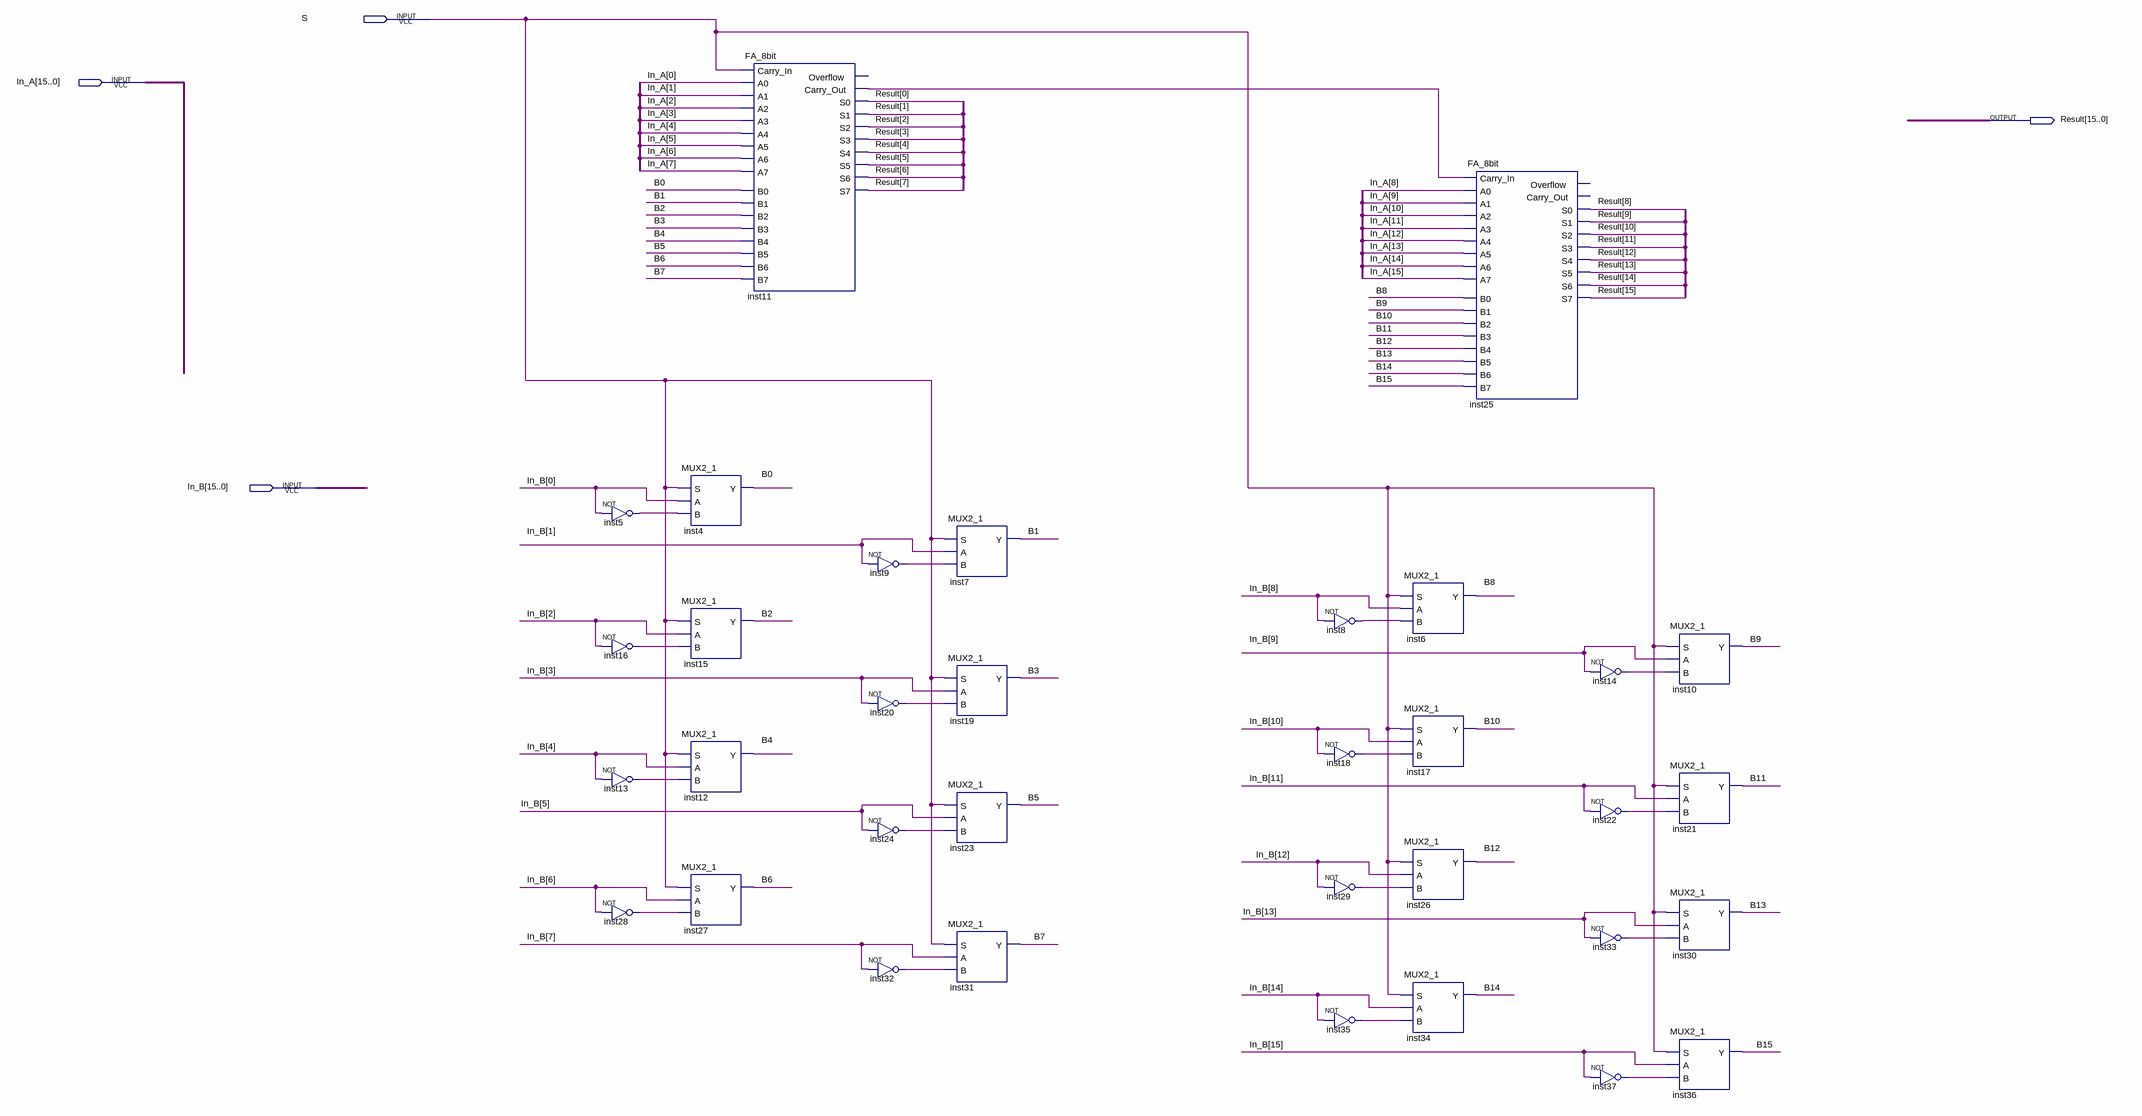
[diagram p0: schematic sheet]
// Quartus schematic Add_Sub_16bit.bdf as structural Verilog: 34 symbols, 4 pins
module Add_Sub_16bit (
  input  S,
  input  [15:0] In_A,
  input  [15:0] In_B,
  output [15:0] Result
);

  wire B0, B1, B2, B3, B4, B5, B6, B7, B8, B9, B10, B11, B12, B13, B14, B15, inst5_out, inst8_out, inst9_out,
       inst11_carry_out, inst13_out, inst14_out, inst16_out, inst18_out, inst20_out, inst22_out, inst24_out,
       inst28_out, inst29_out, inst32_out, inst33_out, inst35_out, inst37_out;

  not inst5 (inst5_out, In_B[0]);
  not inst16 (inst16_out, In_B[2]);
  not inst13 (inst13_out, In_B[4]);
  not inst28 (inst28_out, In_B[6]);
  MUX2_1 inst4 (.S(S), .A(In_B[0]), .B(inst5_out), .Y(B0));
  MUX2_1 inst15 (.S(S), .A(In_B[2]), .B(inst16_out), .Y(B2));
  MUX2_1 inst12 (.S(S), .A(In_B[4]), .B(inst13_out), .Y(B4));
  MUX2_1 inst27 (.S(S), .A(In_B[6]), .B(inst28_out), .Y(B6));
  FA_8bit inst11 (
    .A0(In_A[0]), .B0(B0), .B1(B1), .A1(In_A[1]), .B2(B2), .A2(In_A[2]), .B3(B3), .A3(In_A[3]), .A4(In_A[4]),
    .B4(B4), .B5(B5), .A5(In_A[5]), .B6(B6), .A6(In_A[6]), .B7(B7), .A7(In_A[7]), .Carry_In(S),
    .Carry_Out(inst11_carry_out), .S0(Result[0]), .S1(Result[1]), .S2(Result[2]), .S3(Result[3]),
    .S4(Result[4]), .S5(Result[5]), .S6(Result[6]), .S7(Result[7]));  // open: Overflow
  not inst9 (inst9_out, In_B[1]);
  not inst20 (inst20_out, In_B[3]);
  not inst24 (inst24_out, In_B[5]);
  not inst32 (inst32_out, In_B[7]);
  MUX2_1 inst7 (.S(S), .A(In_B[1]), .B(inst9_out), .Y(B1));
  MUX2_1 inst19 (.S(S), .A(In_B[3]), .B(inst20_out), .Y(B3));
  MUX2_1 inst23 (.S(S), .A(In_B[5]), .B(inst24_out), .Y(B5));
  MUX2_1 inst31 (.S(S), .A(In_B[7]), .B(inst32_out), .Y(B7));
  not inst8 (inst8_out, In_B[8]);
  not inst18 (inst18_out, In_B[10]);
  not inst29 (inst29_out, In_B[12]);
  not inst35 (inst35_out, In_B[14]);
  MUX2_1 inst6 (.S(S), .A(In_B[8]), .B(inst8_out), .Y(B8));
  MUX2_1 inst17 (.S(S), .A(In_B[10]), .B(inst18_out), .Y(B10));
  MUX2_1 inst26 (.S(S), .A(In_B[12]), .B(inst29_out), .Y(B12));
  MUX2_1 inst34 (.S(S), .A(In_B[14]), .B(inst35_out), .Y(B14));
  FA_8bit inst25 (
    .A0(In_A[8]), .B0(B8), .B1(B9), .A1(In_A[9]), .B2(B10), .A2(In_A[10]), .B3(B11), .A3(In_A[11]),
    .A4(In_A[12]), .B4(B12), .B5(B13), .A5(In_A[13]), .B6(B14), .A6(In_A[14]), .B7(B15), .A7(In_A[15]),
    .Carry_In(inst11_carry_out), .S0(Result[8]), .S1(Result[9]), .S2(Result[10]), .S3(Result[11]),
    .S4(Result[12]), .S5(Result[13]), .S6(Result[14]), .S7(Result[15]));  // open: Overflow, Carry_Out
  not inst14 (inst14_out, In_B[9]);
  not inst22 (inst22_out, In_B[11]);
  not inst33 (inst33_out, In_B[13]);
  not inst37 (inst37_out, In_B[15]);
  MUX2_1 inst10 (.S(S), .A(In_B[9]), .B(inst14_out), .Y(B9));
  MUX2_1 inst21 (.S(S), .A(In_B[11]), .B(inst22_out), .Y(B11));
  MUX2_1 inst30 (.S(S), .A(In_B[13]), .B(inst33_out), .Y(B13));
  MUX2_1 inst36 (.S(S), .A(In_B[15]), .B(inst37_out), .Y(B15));
endmodule
